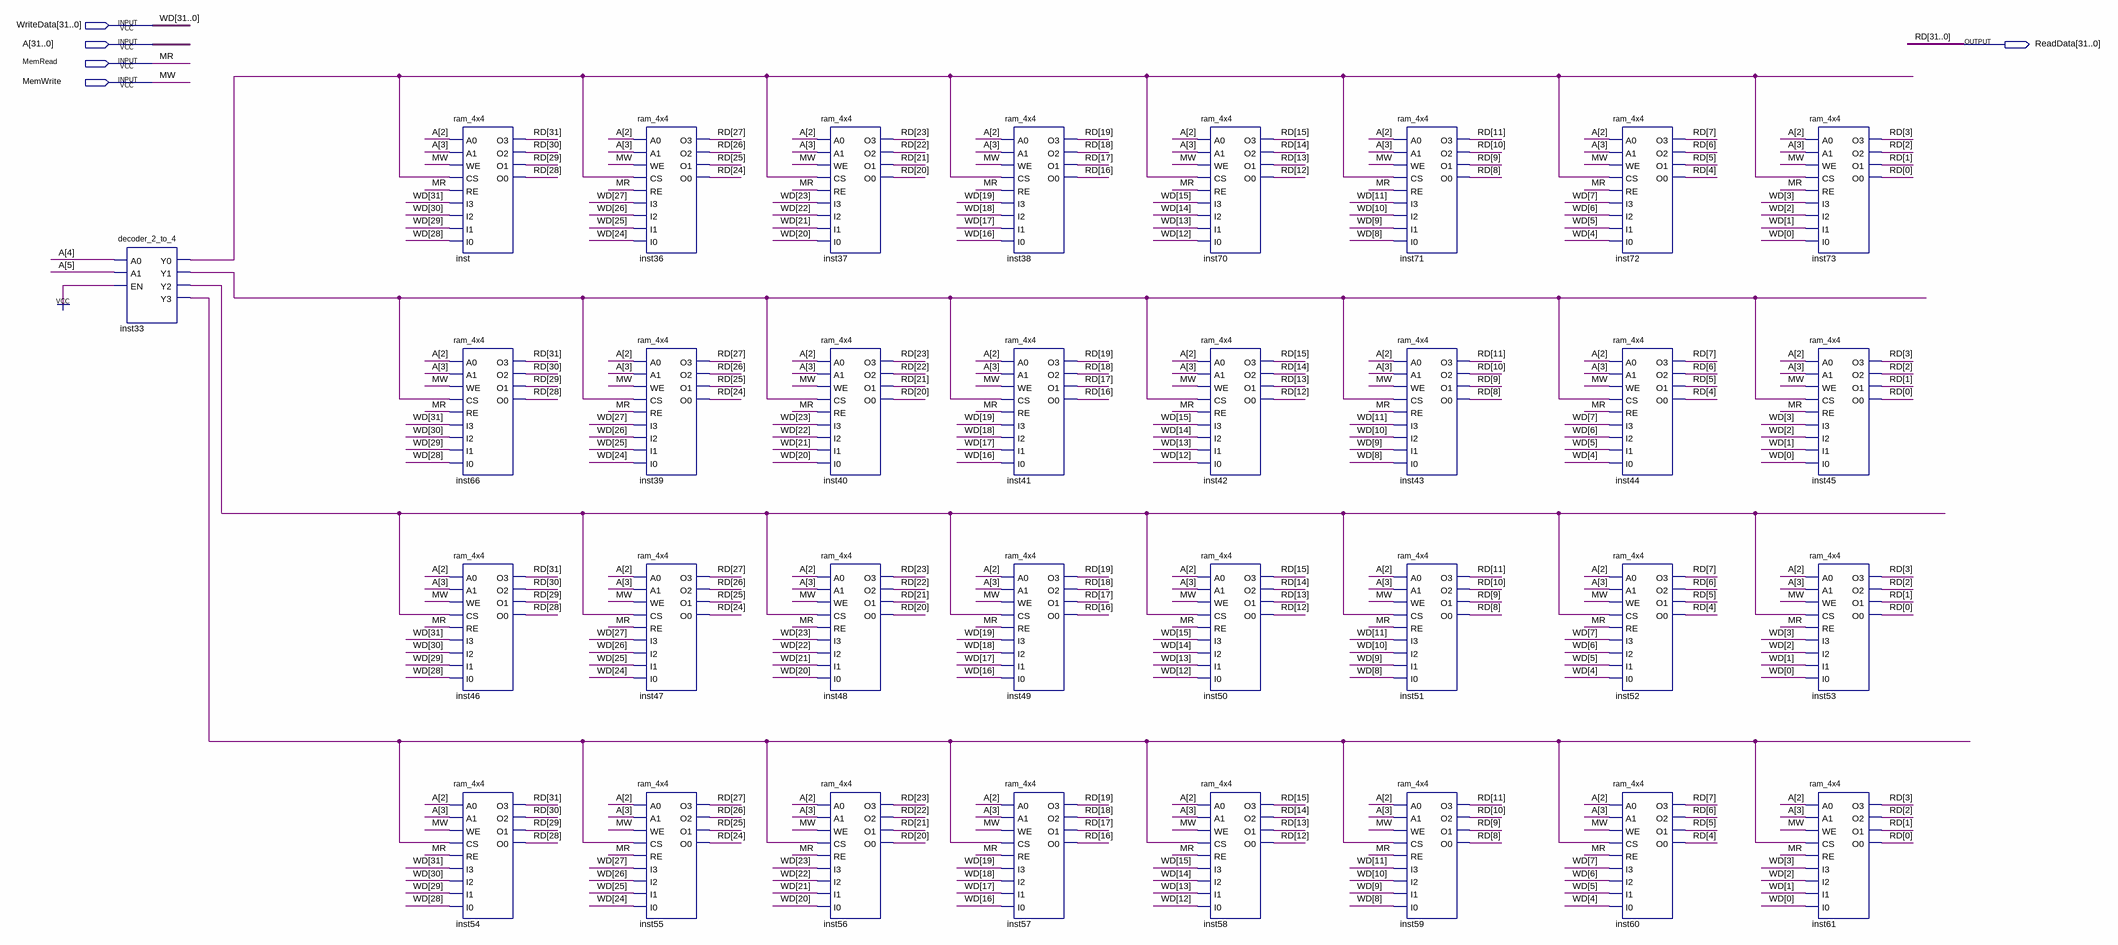
[diagram p0: schematic sheet]
// Quartus schematic memory_16_32bit.bdf as structural Verilog: 33 symbols, 5 pins
module memory_16_32bit (
  input  [31:0] WriteData,
  input  [31:0] A,
  input  MemRead,
  input  MemWrite,
  output [31:0] ReadData
);

  wire inst33_y0, inst33_y1, inst33_y2, inst33_y3;

  decoder_2_to_4 inst33 (
    .A0(A[4]), .A1(A[5]), .EN(1'b1), .Y0(inst33_y0), .Y1(inst33_y1), .Y2(inst33_y2), .Y3(inst33_y3));
  ram_4x4 inst (
    .A0(A[2]), .A1(A[3]), .WE(MemWrite), .CS(inst33_y0), .RE(MemRead), .I3(WriteData[31]),
    .I0(WriteData[28]), .I1(WriteData[29]), .I2(WriteData[30]), .O3(ReadData[31]), .O2(ReadData[30]),
    .O1(ReadData[29]), .O0(ReadData[28]));
  ram_4x4 inst66 (
    .A0(A[2]), .A1(A[3]), .WE(MemWrite), .CS(inst33_y1), .RE(MemRead), .I3(WriteData[31]),
    .I0(WriteData[28]), .I1(WriteData[29]), .I2(WriteData[30]), .O3(ReadData[31]), .O2(ReadData[30]),
    .O1(ReadData[29]), .O0(ReadData[28]));
  ram_4x4 inst46 (
    .A0(A[2]), .A1(A[3]), .WE(MemWrite), .CS(inst33_y2), .RE(MemRead), .I3(WriteData[31]),
    .I0(WriteData[28]), .I1(WriteData[29]), .I2(WriteData[30]), .O3(ReadData[31]), .O2(ReadData[30]),
    .O1(ReadData[29]), .O0(ReadData[28]));
  ram_4x4 inst54 (
    .A0(A[2]), .A1(A[3]), .WE(MemWrite), .CS(inst33_y3), .RE(MemRead), .I3(WriteData[31]),
    .I0(WriteData[28]), .I1(WriteData[29]), .I2(WriteData[30]), .O3(ReadData[31]), .O2(ReadData[30]),
    .O1(ReadData[29]), .O0(ReadData[28]));
  ram_4x4 inst36 (
    .A0(A[2]), .A1(A[3]), .WE(MemWrite), .CS(inst33_y0), .RE(MemRead), .I3(WriteData[27]),
    .I0(WriteData[24]), .I1(WriteData[25]), .I2(WriteData[26]), .O3(ReadData[27]), .O2(ReadData[26]),
    .O1(ReadData[25]), .O0(ReadData[24]));
  ram_4x4 inst39 (
    .A0(A[2]), .A1(A[3]), .WE(MemWrite), .CS(inst33_y1), .RE(MemRead), .I3(WriteData[27]),
    .I0(WriteData[24]), .I1(WriteData[25]), .I2(WriteData[26]), .O3(ReadData[27]), .O2(ReadData[26]),
    .O1(ReadData[25]), .O0(ReadData[24]));
  ram_4x4 inst47 (
    .A0(A[2]), .A1(A[3]), .WE(MemWrite), .CS(inst33_y2), .RE(MemRead), .I3(WriteData[27]),
    .I0(WriteData[24]), .I1(WriteData[25]), .I2(WriteData[26]), .O3(ReadData[27]), .O2(ReadData[26]),
    .O1(ReadData[25]), .O0(ReadData[24]));
  ram_4x4 inst55 (
    .A0(A[2]), .A1(A[3]), .WE(MemWrite), .CS(inst33_y3), .RE(MemRead), .I3(WriteData[27]),
    .I0(WriteData[24]), .I1(WriteData[25]), .I2(WriteData[26]), .O3(ReadData[27]), .O2(ReadData[26]),
    .O1(ReadData[25]), .O0(ReadData[24]));
  ram_4x4 inst37 (
    .A0(A[2]), .A1(A[3]), .WE(MemWrite), .CS(inst33_y0), .RE(MemRead), .I3(WriteData[23]),
    .I0(WriteData[20]), .I1(WriteData[21]), .I2(WriteData[22]), .O3(ReadData[23]), .O2(ReadData[22]),
    .O1(ReadData[21]), .O0(ReadData[20]));
  ram_4x4 inst40 (
    .A0(A[2]), .A1(A[3]), .WE(MemWrite), .CS(inst33_y1), .RE(MemRead), .I3(WriteData[23]),
    .I0(WriteData[20]), .I1(WriteData[21]), .I2(WriteData[22]), .O3(ReadData[23]), .O2(ReadData[22]),
    .O1(ReadData[21]), .O0(ReadData[20]));
  ram_4x4 inst48 (
    .A0(A[2]), .A1(A[3]), .WE(MemWrite), .CS(inst33_y2), .RE(MemRead), .I3(WriteData[23]),
    .I0(WriteData[20]), .I1(WriteData[21]), .I2(WriteData[22]), .O3(ReadData[23]), .O2(ReadData[22]),
    .O1(ReadData[21]), .O0(ReadData[20]));
  ram_4x4 inst56 (
    .A0(A[2]), .A1(A[3]), .WE(MemWrite), .CS(inst33_y3), .RE(MemRead), .I3(WriteData[23]),
    .I0(WriteData[20]), .I1(WriteData[21]), .I2(WriteData[22]), .O3(ReadData[23]), .O2(ReadData[22]),
    .O1(ReadData[21]), .O0(ReadData[20]));
  ram_4x4 inst38 (
    .A0(A[2]), .A1(A[3]), .WE(MemWrite), .CS(inst33_y0), .RE(MemRead), .I3(WriteData[19]),
    .I0(WriteData[16]), .I1(WriteData[17]), .I2(WriteData[18]), .O3(ReadData[19]), .O2(ReadData[18]),
    .O1(ReadData[17]), .O0(ReadData[16]));
  ram_4x4 inst41 (
    .A0(A[2]), .A1(A[3]), .WE(MemWrite), .CS(inst33_y1), .RE(MemRead), .I3(WriteData[19]),
    .I0(WriteData[16]), .I1(WriteData[17]), .I2(WriteData[18]), .O3(ReadData[19]), .O2(ReadData[18]),
    .O1(ReadData[17]), .O0(ReadData[16]));
  ram_4x4 inst49 (
    .A0(A[2]), .A1(A[3]), .WE(MemWrite), .CS(inst33_y2), .RE(MemRead), .I3(WriteData[19]),
    .I0(WriteData[16]), .I1(WriteData[17]), .I2(WriteData[18]), .O3(ReadData[19]), .O2(ReadData[18]),
    .O1(ReadData[17]), .O0(ReadData[16]));
  ram_4x4 inst57 (
    .A0(A[2]), .A1(A[3]), .WE(MemWrite), .CS(inst33_y3), .RE(MemRead), .I3(WriteData[19]),
    .I0(WriteData[16]), .I1(WriteData[17]), .I2(WriteData[18]), .O3(ReadData[19]), .O2(ReadData[18]),
    .O1(ReadData[17]), .O0(ReadData[16]));
  ram_4x4 inst70 (
    .A0(A[2]), .A1(A[3]), .WE(MemWrite), .CS(inst33_y0), .RE(MemRead), .I3(WriteData[15]),
    .I0(WriteData[12]), .I1(WriteData[13]), .I2(WriteData[14]), .O3(ReadData[15]), .O2(ReadData[14]),
    .O1(ReadData[13]), .O0(ReadData[12]));
  ram_4x4 inst42 (
    .A0(A[2]), .A1(A[3]), .WE(MemWrite), .CS(inst33_y1), .RE(MemRead), .I3(WriteData[15]),
    .I0(WriteData[12]), .I1(WriteData[13]), .I2(WriteData[14]), .O3(ReadData[15]), .O2(ReadData[14]),
    .O1(ReadData[13]), .O0(ReadData[12]));
  ram_4x4 inst50 (
    .A0(A[2]), .A1(A[3]), .WE(MemWrite), .CS(inst33_y2), .RE(MemRead), .I3(WriteData[15]),
    .I0(WriteData[12]), .I1(WriteData[13]), .I2(WriteData[14]), .O3(ReadData[15]), .O2(ReadData[14]),
    .O1(ReadData[13]), .O0(ReadData[12]));
  ram_4x4 inst58 (
    .A0(A[2]), .A1(A[3]), .WE(MemWrite), .CS(inst33_y3), .RE(MemRead), .I3(WriteData[15]),
    .I0(WriteData[12]), .I1(WriteData[13]), .I2(WriteData[14]), .O3(ReadData[15]), .O2(ReadData[14]),
    .O1(ReadData[13]), .O0(ReadData[12]));
  ram_4x4 inst71 (
    .A0(A[2]), .A1(A[3]), .WE(MemWrite), .CS(inst33_y0), .RE(MemRead), .I3(WriteData[11]), .I0(WriteData[8]),
    .I1(WriteData[9]), .I2(WriteData[10]), .O3(ReadData[11]), .O2(ReadData[10]), .O1(ReadData[9]),
    .O0(ReadData[8]));
  ram_4x4 inst43 (
    .A0(A[2]), .A1(A[3]), .WE(MemWrite), .CS(inst33_y1), .RE(MemRead), .I3(WriteData[11]), .I0(WriteData[8]),
    .I1(WriteData[9]), .I2(WriteData[10]), .O3(ReadData[11]), .O2(ReadData[10]), .O1(ReadData[9]),
    .O0(ReadData[8]));
  ram_4x4 inst51 (
    .A0(A[2]), .A1(A[3]), .WE(MemWrite), .CS(inst33_y2), .RE(MemRead), .I3(WriteData[11]), .I0(WriteData[8]),
    .I1(WriteData[9]), .I2(WriteData[10]), .O3(ReadData[11]), .O2(ReadData[10]), .O1(ReadData[9]),
    .O0(ReadData[8]));
  ram_4x4 inst59 (
    .A0(A[2]), .A1(A[3]), .WE(MemWrite), .CS(inst33_y3), .RE(MemRead), .I3(WriteData[11]), .I0(WriteData[8]),
    .I1(WriteData[9]), .I2(WriteData[10]), .O3(ReadData[11]), .O2(ReadData[10]), .O1(ReadData[9]),
    .O0(ReadData[8]));
  ram_4x4 inst72 (
    .A0(A[2]), .A1(A[3]), .WE(MemWrite), .CS(inst33_y0), .RE(MemRead), .I3(WriteData[7]), .I0(WriteData[4]),
    .I1(WriteData[5]), .I2(WriteData[6]), .O3(ReadData[7]), .O2(ReadData[6]), .O1(ReadData[5]),
    .O0(ReadData[4]));
  ram_4x4 inst44 (
    .A0(A[2]), .A1(A[3]), .WE(MemWrite), .CS(inst33_y1), .RE(MemRead), .I3(WriteData[7]), .I0(WriteData[4]),
    .I1(WriteData[5]), .I2(WriteData[6]), .O3(ReadData[7]), .O2(ReadData[6]), .O1(ReadData[5]),
    .O0(ReadData[4]));
  ram_4x4 inst52 (
    .A0(A[2]), .A1(A[3]), .WE(MemWrite), .CS(inst33_y2), .RE(MemRead), .I3(WriteData[7]), .I0(WriteData[4]),
    .I1(WriteData[5]), .I2(WriteData[6]), .O3(ReadData[7]), .O2(ReadData[6]), .O1(ReadData[5]),
    .O0(ReadData[4]));
  ram_4x4 inst60 (
    .A0(A[2]), .A1(A[3]), .WE(MemWrite), .CS(inst33_y3), .RE(MemRead), .I3(WriteData[7]), .I0(WriteData[4]),
    .I1(WriteData[5]), .I2(WriteData[6]), .O3(ReadData[7]), .O2(ReadData[6]), .O1(ReadData[5]),
    .O0(ReadData[4]));
  ram_4x4 inst73 (
    .A0(A[2]), .A1(A[3]), .WE(MemWrite), .CS(inst33_y0), .RE(MemRead), .I3(WriteData[3]), .I0(WriteData[0]),
    .I1(WriteData[1]), .I2(WriteData[2]), .O3(ReadData[3]), .O2(ReadData[2]), .O1(ReadData[1]),
    .O0(ReadData[0]));
  ram_4x4 inst45 (
    .A0(A[2]), .A1(A[3]), .WE(MemWrite), .CS(inst33_y1), .RE(MemRead), .I3(WriteData[3]), .I0(WriteData[0]),
    .I1(WriteData[1]), .I2(WriteData[2]), .O3(ReadData[3]), .O2(ReadData[2]), .O1(ReadData[1]),
    .O0(ReadData[0]));
  ram_4x4 inst53 (
    .A0(A[2]), .A1(A[3]), .WE(MemWrite), .CS(inst33_y2), .RE(MemRead), .I3(WriteData[3]), .I0(WriteData[0]),
    .I1(WriteData[1]), .I2(WriteData[2]), .O3(ReadData[3]), .O2(ReadData[2]), .O1(ReadData[1]),
    .O0(ReadData[0]));
  ram_4x4 inst61 (
    .A0(A[2]), .A1(A[3]), .WE(MemWrite), .CS(inst33_y3), .RE(MemRead), .I3(WriteData[3]), .I0(WriteData[0]),
    .I1(WriteData[1]), .I2(WriteData[2]), .O3(ReadData[3]), .O2(ReadData[2]), .O1(ReadData[1]),
    .O0(ReadData[0]));

  // Other names for the same wires on the sheet: MR = MemRead; MW = MemWrite; RD[31:0] = ReadData;
  //   WD[31:0] = WriteData
endmodule
